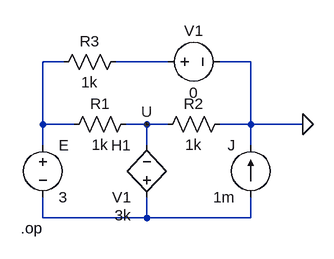
[diagram p0: schematic DC_zr_sterowane.asc]
DC_zr_sterowane.asc, the LTspice schematic file:
Version 4
SHEET 1 880 680
WIRE 64 -16 32 -16
WIRE 224 -16 144 -16
WIRE 352 -16 304 -16
WIRE 32 80 32 -16
WIRE 80 80 32 80
WIRE 192 80 160 80
WIRE 224 80 192 80
WIRE 352 80 352 -16
WIRE 352 80 304 80
WIRE 432 80 352 80
WIRE 32 112 32 80
WIRE 192 112 192 80
WIRE 352 112 352 80
WIRE 32 224 32 192
WIRE 192 224 192 192
WIRE 192 224 32 224
WIRE 352 224 352 192
WIRE 352 224 192 224
FLAG 432 80 0
FLAG 192 80 U
SYMBOL voltage 32 96 R0
WINDOW 123 0 0 Left 0
WINDOW 39 0 0 Left 0
SYMATTR InstName E
SYMATTR Value 3
SYMBOL res 176 64 R90
WINDOW 0 0 56 VBottom 2
WINDOW 3 32 56 VTop 2
SYMATTR InstName R1
SYMATTR Value 1k
SYMBOL res 320 64 R90
WINDOW 0 0 56 VBottom 2
WINDOW 3 32 56 VTop 2
SYMATTR InstName R2
SYMATTR Value 1k
SYMBOL current 352 192 R180
WINDOW 0 24 80 Left 2
WINDOW 3 24 0 Left 2
WINDOW 123 0 0 Left 0
WINDOW 39 0 0 Left 0
SYMATTR InstName J
SYMATTR Value 1m
SYMBOL res 160 -32 R90
WINDOW 0 0 56 VBottom 2
WINDOW 3 32 56 VTop 2
SYMATTR InstName R3
SYMATTR Value 1k
SYMBOL h 192 208 R180
WINDOW 0 24 96 Left 2
WINDOW 3 24 16 Left 2
WINDOW 123 24 -12 Left 2
SYMATTR InstName H1
SYMATTR Value V1
SYMATTR Value2 3k
SYMBOL voltage 208 -16 R270
WINDOW 0 32 56 VTop 2
WINDOW 3 -32 56 VBottom 2
WINDOW 123 0 0 Left 0
WINDOW 39 0 0 Left 0
SYMATTR InstName V1
SYMATTR Value 0
TEXT -2 240 Left 2 !.op

The netlist it stands for:
* DC_zr_sterowane.asc
V§E N001 N003 3
R1 U N001 1k
R2 0 U 1k
I§J N003 0 1m
R3 N002 N001 1k
H1 N003 U V1 3k
V1 N002 0 0
.op
.backanno
.end